# Altium schematic sheet 05_AuxPower.SchDoc
size A3; SheetNumber: 6; SheetTotal: 6
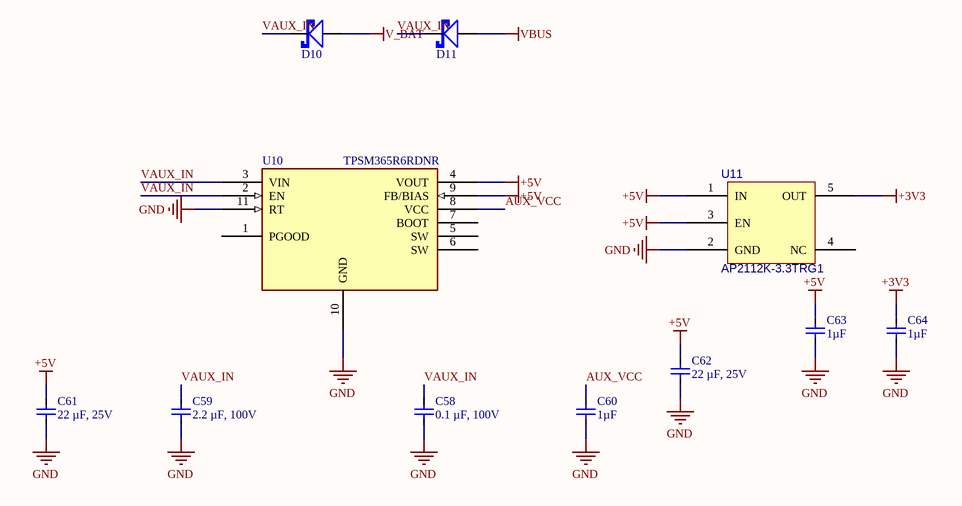
[diagram p0: 05_AuxPower.SchDoc]

## Parts
C58  0.1 µF, 100V  [CAPC1608X10N]
C59  2.2 µF, 100V  [CAPC3216X20N]
C60  1µF  [CAPC1608X10N]
C61  22 µF, 25V  [CAPC3225X30N]
C62  22 µF, 25V  [CAPC3225X30N]
C63  1µF  [CAPC1608X10N]
C64  1µF  [CAPC1608X10N]
D10  PMEG10030ELPX  [ST-SOD128FLAT]  (value not drawn)
D11  PMEG10030ELPX  [ST-SOD128FLAT]  (value not drawn)
U10  TPSM365R6RDNR  [TI-RDN0011A]
U11  AP2112K-3.3TRG1  [SOT95P280X145-5N]

## Nets
+3V3: C64.2 U11.5(OUT)
+5V: C61.2 C62.2 C63.2 U10.4(VOUT) U10.9(FB/BIAS) U11.1(IN) U11.3(EN)
GND: C58.1 C59.1 C60.1 C61.1 C62.1 C63.1 C64.1 U10.10(GND) U10.11(RT) U11.2(GND)
V_BAT: D10.A
VBUS: D11.A
AUX_VCC: C60.2 U10.8(VCC)
VAUX_IN: C58.2 C59.2 D10.K D11.K U10.2(EN) U10.3(VIN)

Not connected (* = marked no-connect by the designer): U10 1(PGOOD) 5(SW) 6(SW) 7(BOOT); U11 4(NC)

## Library data of the parts
C58 = CGA3E3X7S2A104K080AB: CAP CER 0.1UF 100V X7S 0603; Manufacturer 1: TDK; AEC-Q200: True; Capacitance: 0.1 µF; Tolerance: ±10%; Case Code (Imperial): 0603; Manufacturer Part Number 1: CGA3E3X7S2A104K080AB; Mounting Type: Surface Mount, MLCC; Part Name: CGA3E3X7S2A104K080AB; Supplier 1: Digi-Key; Supplier Part Number 1: 445-6938-2-ND; Temperature Coefficient: X7S; Voltage Rating: 100V
C59 = CGA5L3X7S2A225K160AB: CAP CER 2.2UF 100V X7S 1206; Manufacturer 1: TDK Corporation; AEC-Q200: True; Capacitance: 2.2 µF; Tolerance: ±10%; Case Code (Imperial): 1206; Manufacturer Part Number 1: CGA5L3X7S2A225K160AB; Mounting Type: Surface Mount, MLCC; Part Name: CGA5L3X7S2A225K160AB; Supplier 1: Digi-Key; Temperature Coefficient: X7S; Voltage Rating: 100V
C60 C63 C64 = CGA3E1X7R1C105M080AC: CAP CER 1UF 16V X7R 0603; Manufacturer 1: TDK Corporation; AEC-Q200: True; Tolerance: ±20%; Capacitance: 1 µF; Case Code (Imperial): 0603; Manufacturer Part Number 1: CGA3E1X7R1C105M080AC; Mounting Type: 0.063" L x 0.031" W (1.60mm x 0.80mm); Part Name: CGA3E1X7R1C105M080AC; Supplier 1: Digi-Key; Supplier Part Number 1: 445-12540-1-ND; Temperature Coefficient: X7R; Voltage Rating: 16V
C61 C62 = CGA6P3X7R1E226M250AB: CAP CER 22UF 25V X7R 1210; Manufacturer 1: TDK; AEC-Q200: True; Capacitance: 22 µF; Tolerance: ±20%; Case Code (Imperial): 1210; Manufacturer Part Number 1: CGA6P3X7R1E226M250AB; Mounting Type: Surface Mount, MLCC; Part Name: CGA6P3X7R1E226M250AB; Supplier 1: Digi-Key; Supplier Part Number 1: 445-180363-2-ND; Temperature Coefficient: X7R; Voltage Rating: 25V
D10 D11 = PMEG10030ELPX: DIODE SCHOTTKY 100V 3A SOD128; Manufacturer 1: Nexperia USA Inc.; Voltage Forward: 770 mV @ 3 A; AEC-Q200: False; Part Name: PMEG10030ELPX; Supplier 1: Digi-Key; Supplier Part Number 1: 1727-2397-1-ND; Manufacturer Part Number 1: PMEG10030ELPX; Diode Type: Schottky; Current Average: 3A; Voltage Reverse: 100 V; Package / Case: SOD-128; Supplier Device Package: SOD-128/CFP5
U10 = TPSM365R6RDNR: 3-V TO 65-V INPUT, 1-V TO 13-V O; Manufacturer 1: Texas Instruments; Function: Buck power module 3-65V in, 600mA; AEC-Q200: False; Part Name: TPSM365R6RDNR; Supplier 1: Digi-Key; Supplier Part Number 1: 296-TPSM365R6RDNRTR-ND; Manufacturer Part Number 1: TPSM365R6RDNR; Package / Case: 11-PowerVFQFN Module; Supplier Device Package: 11-QFN-FCMOD (3.5x4.5)
U11 = AP2112K-3.3TRG1: IC REG LINEAR 3.3V 600MA SOT25; Manufacturer 1: Diodes Incorporated; AEC-Q200: False; Part Name: AP2112K-3.3TRG1; Supplier 1: Digi-Key; Supplier Part Number 1: AP2112K-3.3TRG1DICT-ND; Manufacturer Part Number 1: AP2112K-3.3TRG1; Function: -; Package / Case: SC-74A, SOT-753; Supplier Device Package: SOT-25